# Altium schematic sheet Top Sheet.SchDoc
size A
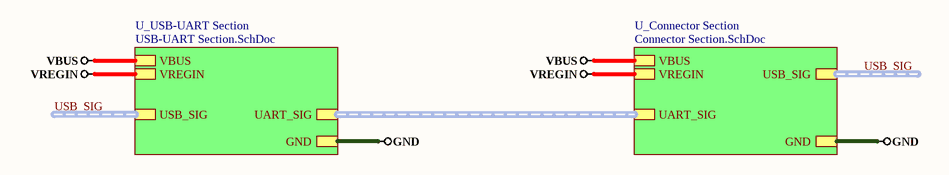
[diagram p0: Top Sheet.SchDoc]

## Sub-sheets
U_Connector Section = Connector Section.SchDoc: VBUS, VREGIN, GND, UART_SIG (harness UART_SIG), USB_SIG (harness USB_SIG)
U_USB-UART Section = USB-UART Section.SchDoc: UART_SIG (harness UART_SIG), USB_SIG (harness USB_SIG), VBUS, VREGIN, GND

## Nets
GND: sheet U_USB-UART Section/GND, sheet U_Connector Section/GND
VBUS: sheet U_USB-UART Section/VBUS, sheet U_Connector Section/VBUS
VREGIN: sheet U_USB-UART Section/VREGIN, sheet U_Connector Section/VREGIN

## Buses and harness runs
harness sheet U_Connector Section/UART_SIG = sheet U_USB-UART Section/UART_SIG
harness USB_SIG = sheet U_Connector Section/USB_SIG
harness USB_SIG = sheet U_USB-UART Section/USB_SIG